# Altium schematic sheet Sheet4.SchDoc
size A; SheetNumber: 2; SheetTotal: 4
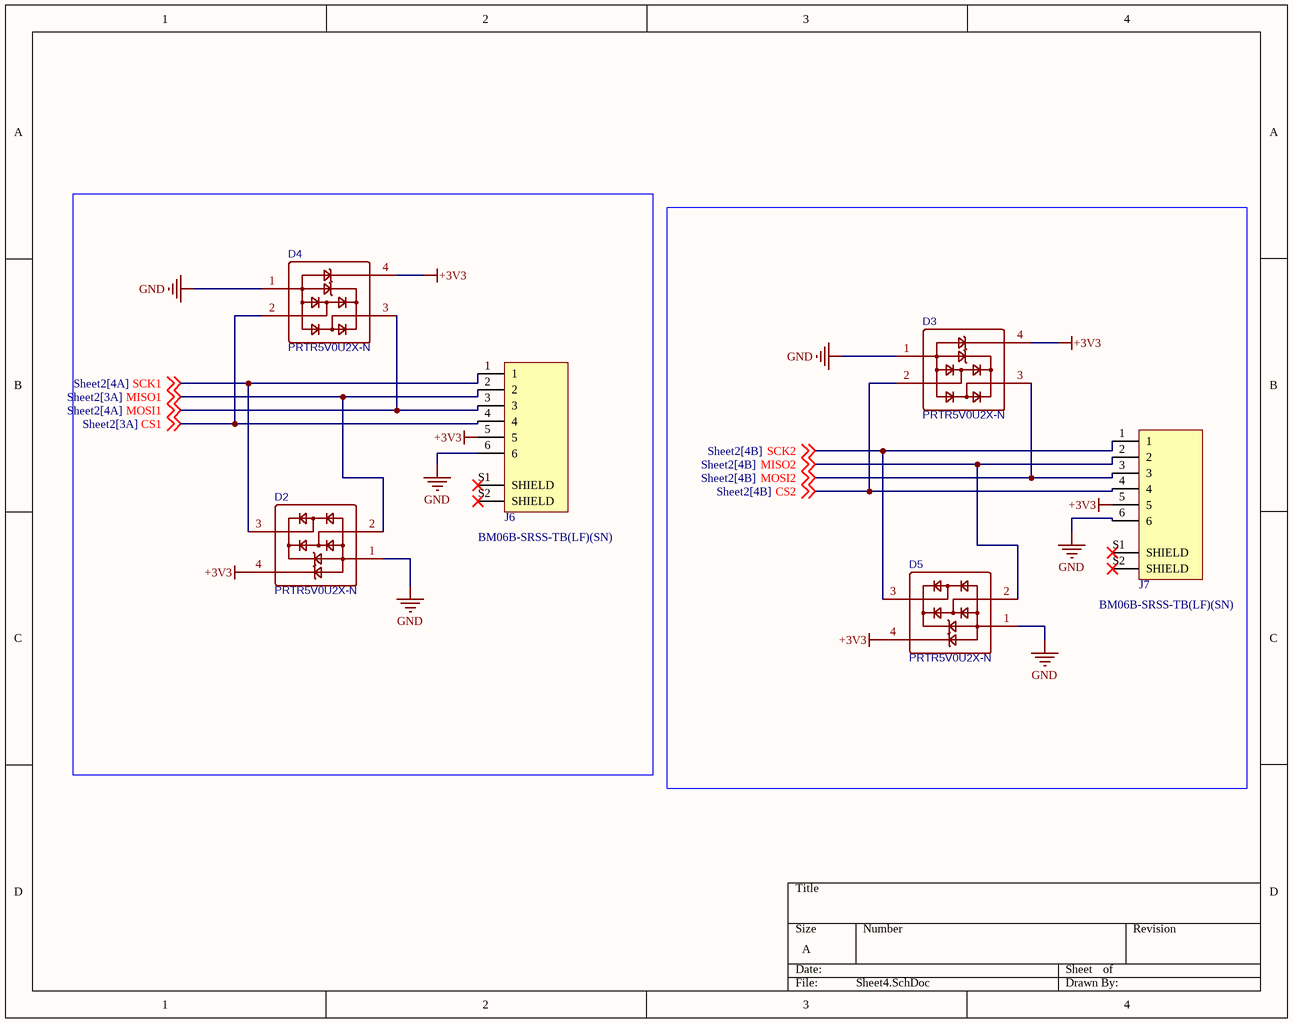
[diagram p0: Sheet4.SchDoc]

## Parts
D2  PRTR5V0U2X-N  [PRTR5V0U2X-N]
D3  PRTR5V0U2X-N  [PRTR5V0U2X-N]
D4  PRTR5V0U2X-N  [PRTR5V0U2X-N]
D5  PRTR5V0U2X-N  [PRTR5V0U2X-N]
J6  BM06B-SRSS-TB(LF)(SN)  [BM06B-SRSS-TB(LF)(SN)]
J7  BM06B-SRSS-TB(LF)(SN)  [BM06B-SRSS-TB(LF)(SN)]

## Nets
+3V3: D2.4 D3.4 D4.4 D5.4 J6.5 J7.5
GND: D2.1 D3.1 D4.1 D5.1 J6.6 J7.6
CS1: D4.2 J6.4 ; off-sheet CS1
CS2: D3.2 J7.4 ; off-sheet CS2
MISO1: D2.2 J6.2 ; off-sheet MISO1
MISO2: D5.2 J7.2 ; off-sheet MISO2
MOSI1: D4.3 J6.3 ; off-sheet MOSI1
MOSI2: D3.3 J7.3 ; off-sheet MOSI2
SCK1: D2.3 J6.1 ; off-sheet SCK1
SCK2: D5.3 J7.1 ; off-sheet SCK2

Not connected (* = marked no-connect by the designer): J6 S1(SHIELD)* S2(SHIELD)*; J7 S1(SHIELD)* S2(SHIELD)*

## Library data of the parts
D2-D5 = PRTR5V0U2X-N: Manufacturer: BORN(伯恩半导体); Contributor: LCSC; Supplier: LCSC; Supplier Part: C316030; Manufacturer Part: PRTR5V0U2X-N; JLCPCB Part Class: Extended Part; spicePre: D; spiceSymbolName: PRTR5V0U2X-N